# EAGLE design Frank_Hertz_Transimpedance_Amplifier (EAGLE 9.6.2)
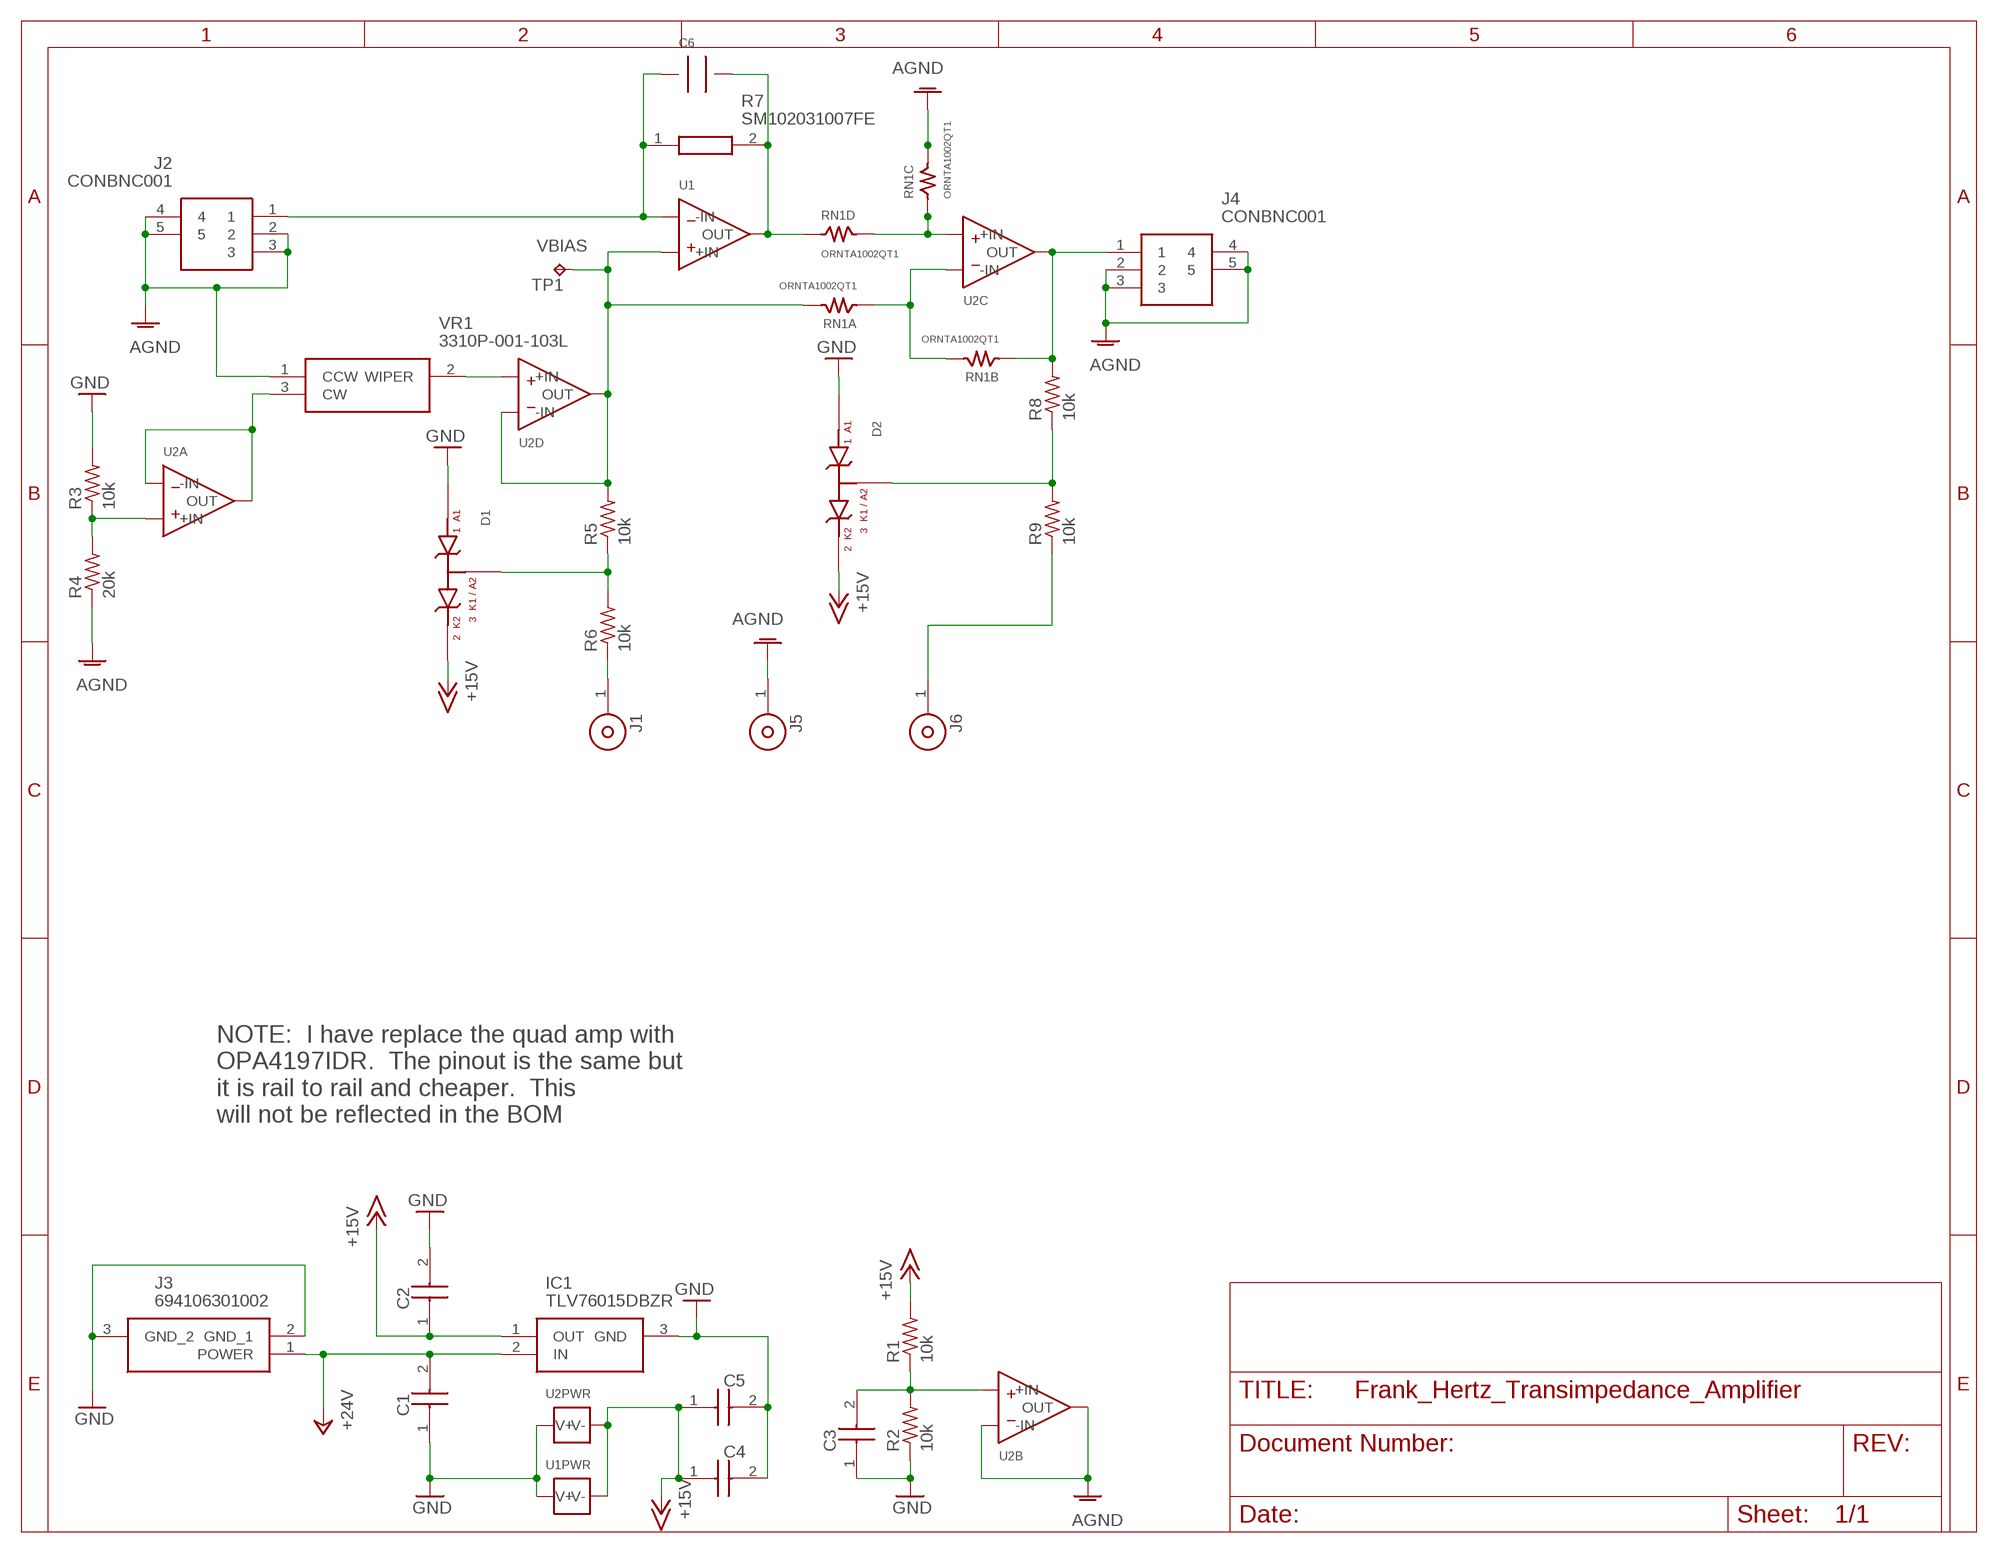
[diagram p0: schematic, sheet 1]

## Parts
C1  1uF  KAF21KR71H105JU  [CAPC2012X140N]
C2  1uF  KAF21KR71H105JU  [CAPC2012X140N]
C3  1uF  KAF21KR71H105JU  [CAPC2012X140N]
C4  CC0603KRX7R8BB104  [CAPC1608X90N]
C5  CC0603KRX7R8BB104  [CAPC1608X90N]
C6  C315C109D2G5TA_10.16MM  [C315_BENT_10.16MM]
D1  BAS70_04_SOT23COMMERCIAL_REELNXP  [SOT23-3_NEXPERIA]
D2  BAS70_04_SOT23COMMERCIAL_REELNXP  [SOT23-3_NEXPERIA]
IC1  TLV76015DBZR  [SOT95P237X112-3N]
J1  CINCH_108-0904-001  [CINCH_108-0904-001_BODGE]
J2  CONBNC001  [CONBNC001]
J3  694106301002  [694106301002]
J4  CONBNC001  [CONBNC001]
J5  CINCH_108-0904-001  [CINCH_108-0904-001_BODGE]
J6  CINCH_108-0904-001  [CINCH_108-0904-001_BODGE]
R1  10k  R-US_R0805  [R0805]
R2  10k  R-US_R0805  [R0805]
R3  10k  R-US_R0805  [R0805]
R4  20k  R-US_R0805  [R0805]
R5  10k  R-US_R0805  [R0805]
R6  10k  R-US_R0805  [R0805]
R7  SM102031007FE  [SM102031007FE]
R8  10k  R-US_R0805  [R0805]
R9  10k  R-US_R0805  [R0805]
RN1  ORNTA1002QT1  [SOIC8_MS012_AA_1.27MM]
TP1  TPB1,27  [B1,27]
U1  LMC6081IN/NOPB  [PDIP-8_300MIL]
U2  OPA4227UA_SOIC14  [SOIC-14_D]
VR1  3310P-001-103L  [3310P001103L]

## Nets
+15V: C2.1 C4.1 C5.1 D1.2(K2) D2.2(K2) IC1.1(OUT) R1.2 U1.7(V+) U2.4(PWR:V+)
+24V: C1.2 IC1.2(IN) J3.1(POWER)
AGND: J2.2 J2.3 J2.4 J2.5 J4.2 J4.3 J4.4 J4.5 J5.1 R4.1 RN1.6 U2.6(B:-IN) U2.7(B:OUT) VR1.1(CCW)
GND: C1.1 C2.2 C3.1 C4.2 C5.2 D1.1(A1) D2.1(A1) IC1.3(GND) J3.2(GND_1) J3.3(GND_2) R2.1 R3.2 U1.4(V-) U2.11(PWR:V-)
N$1: U2.12(D:+IN) VR1.2(WIPER)
N$2: C3.2 R1.1 R2.2 U2.5(B:+IN)
N$3: J6.1 R9.1
N$4: R3.1 R4.2 U2.3(A:+IN)
N$5: U2.1(A:OUT) U2.2(A:-IN) VR1.3(CW)
N$6: C6.1 J2.1 R7.1 U1.2(-IN)
N$7: RN1.1 RN1.7 U2.9(C:-IN)
N$8: C6.2 R7.2 RN1.4 U1.6(OUT)
N$9: RN1.3 RN1.5 U2.10(C:+IN)
N$10: J4.1 R8.2 RN1.2 U2.8(C:OUT)
N$11: D1.3(K1_A2) R5.1 R6.2
N$12: J1.1 R6.1
N$13: D2.3(K1_A2) R8.1 R9.2
VBIAS: R5.2 RN1.8 TP1.TP U1.3(+IN) U2.13(D:-IN) U2.14(D:OUT)

## Notes on the sheet
- NOTE:  I have replace the quad amp with 
  OPA4197IDR.  The pinout is the same but
  it is rail to rail and cheaper.  This
  will not be reflected in the BOM

## Library data of the parts
C1-C3 = KAF21KR71H105JU:KAF21KR71H105JU: Multilayer Ceramic Capacitors MLCC - SMD/SMT 50V 1uF X7R 0805 5% AEC-Q200 FlexiTerm Source: Datasheet <https://www.mouser.ph/ProductDetail/KYOCERA-AVX/KAF21KR71H105JU?qs=9vOqFld9vZWh8YVe5AsImg==&srsltid=AfmBOoplmrgUQOhbOhIhlm3WXiOMcA4op3G5lIOrTOHn0-XwebEw1J19>; DESCRIPTION: Multilayer Ceramic Capacitors MLCC - SMD/SMT 50V 1uF X7R 0805 5% AEC-Q200 FlexiTerm; HEIGHT: 1.4mm; MANUFACTURER_NAME: Kyocera AVX; MANUFACTURER_PART_NUMBER: KAF21KR71H105JU
C4 C5 = CC0603KRX7R8BB104:CC0603KRX7R8BB104: Cap Ceramic 0.1uF 25V X7R 10% Pad SMD 0603 125C T/R Source: Datasheet <https://www.arrow.com/en/products/cc0603krx7r8bb104/yageo?region=nac>; DESCRIPTION: Cap Ceramic 0.1uF 25V X7R 10% Pad SMD 0603 125C T/R; HEIGHT: 0.9mm; MANUFACTURER_NAME: Yageo Group; MANUFACTURER_PART_NUMBER: CC0603KRX7R8BB104; MOUSER_PART_NUMBER: 603-CC603KRX7R8BB104; MOUSER_PRICE-STOCK: https://www.mouser.co.uk/ProductDetail/YAGEO/CC0603KRX7R8BB104?qs=AgBp2OyFlx%252B4QOgEm%2Fb3YQ%3D%3D
C6 = KEMET_C315_1pF_C0G_10.16mm_BentLead:C315C109D2G5TA_10.16MM: KEMET C315C109D2G5TA, 1 pF, C0G/NP0, 200 V radial capacitor. Custom 10.16 mm PCB lead spacing to match Ohmite SM102031007FE 1 GΩ resistor footprint. Form capacitor leads outward before insertion; do not force the ceramic body.; CAPACITANCE: 1pF; DIELECTRIC: C0G/NP0; FOOTPRINT_NOTE: Custom 10.16mm formed-lead spacing; MANUFACTURER: KEMET; MPN: C315C109D2G5TA; VOLTAGE: 200V
D1 D2 = BAS70-04_SOT23:BAS70_04_SOT23: BAS70-04 dual-series Schottky diode Nexperia SOT23 (TO-236AB). Pin 1 = A1, pin 3 = K1/A2 series junction, pin 2 = K2. The symbol displays both physical diodes and all three pin numbers.; CONFIGURATION: DUAL SERIES; I_F: 70 mA; MANUFACTURER: Nexperia; MOUSER: 771-BAS70-04-T/R; MPN: BAS70-04,215; PACKAGE: SOT23 (TO-236AB); V_R: 70 V
IC1 = TLV76015DBZR:TLV76015DBZR: LDO Voltage Regulators 100mA, 30V Wide-VIN, Fixed-Output Linear-Voltage Regulator 3-SOT-23 -40 to 125 Source: Datasheet <http://www.ti.com/lit/gpn/tlv760>; DESCRIPTION: LDO Voltage Regulators 100mA, 30V Wide-VIN, Fixed-Output Linear-Voltage Regulator 3-SOT-23 -40 to 125; HEIGHT: 1.12mm; MANUFACTURER_NAME: Texas Instruments; MANUFACTURER_PART_NUMBER: TLV76015DBZR; MOUSER_PART_NUMBER: 595-TLV76015DBZR; MOUSER_PRICE-STOCK: https://www.mouser.co.uk/ProductDetail/Texas-Instruments/TLV76015DBZR?qs=HXFqYaX1Q2y4Be22WCYAvQ%3D%3D
J1 J5 J6 = Cinch_108-0904-001_Banana_Jack_v2:CINCH_108-0904-001: Cinch 108-0904-001 insulated banana jack Custom board-mount implementation: the jack passes through a large mechanical PCB hole and its rear solder terminal is jumpered to a nearby bottom-side SMD pad.; MANUFACTURER: Cinch Connectivity Solutions; MPN: 108-0904-001
J2 J4 = CONBNC001:CONBNC001: Body Features: Body Material Brass | Body Plating Material Nickel | Configuration Features: Number of Coaxial Contacts 1 | Number of Positions 1 | Electrical Characteristics: Impedance 50 OHM | Mechanical Attachment: Connector Mounting Type Board Mount | RF Connector Coupling Mechanism Bayonet | Operation/Application: Operating Frequency 3 GHZ | Circuit Application Signal | Other: Dielectric Material Polytetrafluoroethylene (PTFE) | Product Type Features: RF Connector Style Jack | Connector & Contact Termin Source: Datasheet <https://www.te.com/commerce/DocumentDelivery/DDEController?Action=srchrtrv&DocNm=CONBNC001&DocType=Data Sheet&DocLang=English&PartCntxt=CONBNC001&DocFormat=pdf>; DESCRIPTION: Body Features: Body Material Brass | Body Plating Material Nickel | Configuration Features: Number of Coaxial Contacts 1 | Number of Positions 1 | Electrical Characteristics: Impedance 50 OHM | Mechanical Attachment: Connector Mounting Type Board Mount | RF Connector Coupling Mechanism Bayonet | Operation/Application: Operating Frequency 3 GHZ | Circuit Application Signal | Other: Dielectric Material Polytetrafluoroethylene (PTFE) | Product Type Features: RF Connector Style Jack | Connector & Contact Termin; HEIGHT: 14.9mm; MANUFACTURER_NAME: TE Connectivity; MANUFACTURER_PART_NUMBER: CONBNC001; MOUSER_PART_NUMBER: 712-CONBNC001; MOUSER_PRICE-STOCK: https://www.mouser.co.uk/ProductDetail/TE-Connectivity-Linx-Technologies/CONBNC001?qs=doiCPypUmgHczHAGaJs8Lg%3D%3D
J3 = 694106301002:694106301002: WR-DCPJ_THT_R/A_Plastic DCPowerJack_THT_R/A_Plastic_CenterPin_ 2.0 Source: Datasheet <https://www.we-online.com/catalog/datasheet/694106301002.pdf>; DESCRIPTION: WR-DCPJ_THT_R/A_Plastic DCPowerJack_THT_R/A_Plastic_CenterPin_ 2.0; HEIGHT: 11mm; MANUFACTURER_NAME: Wurth Elektronik; MANUFACTURER_PART_NUMBER: 694106301002; MOUSER_PART_NUMBER: 710-694106301002; MOUSER_PRICE-STOCK: https://www.mouser.co.uk/ProductDetail/Wurth-Elektronik/694106301002?qs=a9WhcLg8qCwOEkcI62k5mA%3D%3D
R1-R6 R8 R9 = rcl:R-US_: RESISTOR, American symbol; SPICEPREFIX: R
R7 = SM102031007FE:SM102031007FE: Thick Film Resistors - Through Hole 1000M ohms 1% Source: Datasheet <https://componentsearchengine.com/Datasheets/2/SM102031007FE.pdf>; DESCRIPTION: Thick Film Resistors - Through Hole 1000M ohms 1%; HEIGHT: 8.64mm; MANUFACTURER_NAME: Ohmite; MANUFACTURER_PART_NUMBER: SM102031007FE; MOUSER_PART_NUMBER: 588-SM102031007FE; MOUSER_PRICE-STOCK: https://www.mouser.co.uk/ProductDetail/Ohmite/SM102031007FE?qs=i1vWiB0WGw%2FlCaVxH5tlIA%3D%3D
RN1 = Vishay_ORNTA1002QT1_Invokable:ORNTA1002QT1: Vishay ORNTA1002QT1: four isolated 10 kΩ matched thin-film resistors. Q tolerance code = ±0.05% absolute / ±0.01% ratio.; ABS_TOL: ±0.05%; MANUFACTURER: Vishay Dale Thin Film; MPN: ORNTA1002QT1; RATIO_TOL: ±0.01%; RESISTANCE: 10 kΩ x4 isolated; TCR: ±25 ppm/°C absolute; ±5 ppm/°C tracking
TP1 = testpad:TP: Test pad
U1 = LMC6081IN_PDIP8:LMC6081: LMC6081IN/NOPB — single precision CMOS op amp, ultra-low input bias, PDIP-8. Op-amp gate: -IN=2, +IN=3, OUT=6. Power gate PWR (INVOKE separately): V-=4, V+=7. Pins 1, 5, and 8 are NC and intentionally have no schematic gate connection.; CHANNELS: 1; MANUFACTURER: Texas Instruments; MPN: LMC6081IN/NOPB; PACKAGE: PDIP-8 (P)
U2 = OPA4227_Quad_OpAmp_EAGLE:OPA4227: OPA4227 — quad high-precision, low-noise operational amplifier. Gate A: OUT=1, -IN=2, +IN=3. Gate B: +IN=5, -IN=6, OUT=7. Gate C: OUT=8, -IN=9, +IN=10. Gate D: +IN=12, -IN=13, OUT=14. Power gate PWR (invoke separately): V+=4, V-=11. A-D are interchangeable gates and can be placed/invoked separately.; MANUFACTURER: Texas Instruments; MPN: OPA4227UA; PACKAGE: SOIC-14 (D)
VR1 = 3310P-001-103L:3310P-001-103L: Potentiometers 9mm 10Kohms Single Cup Source: Datasheet <https://componentsearchengine.com/Datasheets/2/3310P-001-103L.pdf>; DESCRIPTION: Potentiometers 9mm 10Kohms Single Cup; HEIGHT: 11.79mm; MANUFACTURER_NAME: Bourns; MANUFACTURER_PART_NUMBER: 3310P-001-103L; MOUSER_PART_NUMBER: 652-3310P-001-103L; MOUSER_PRICE-STOCK: https://www.mouser.co.uk/ProductDetail/Bourns/3310P-001-103L?qs=eLugBjTgzvMckyzv4fvguA%3D%3D

## Board
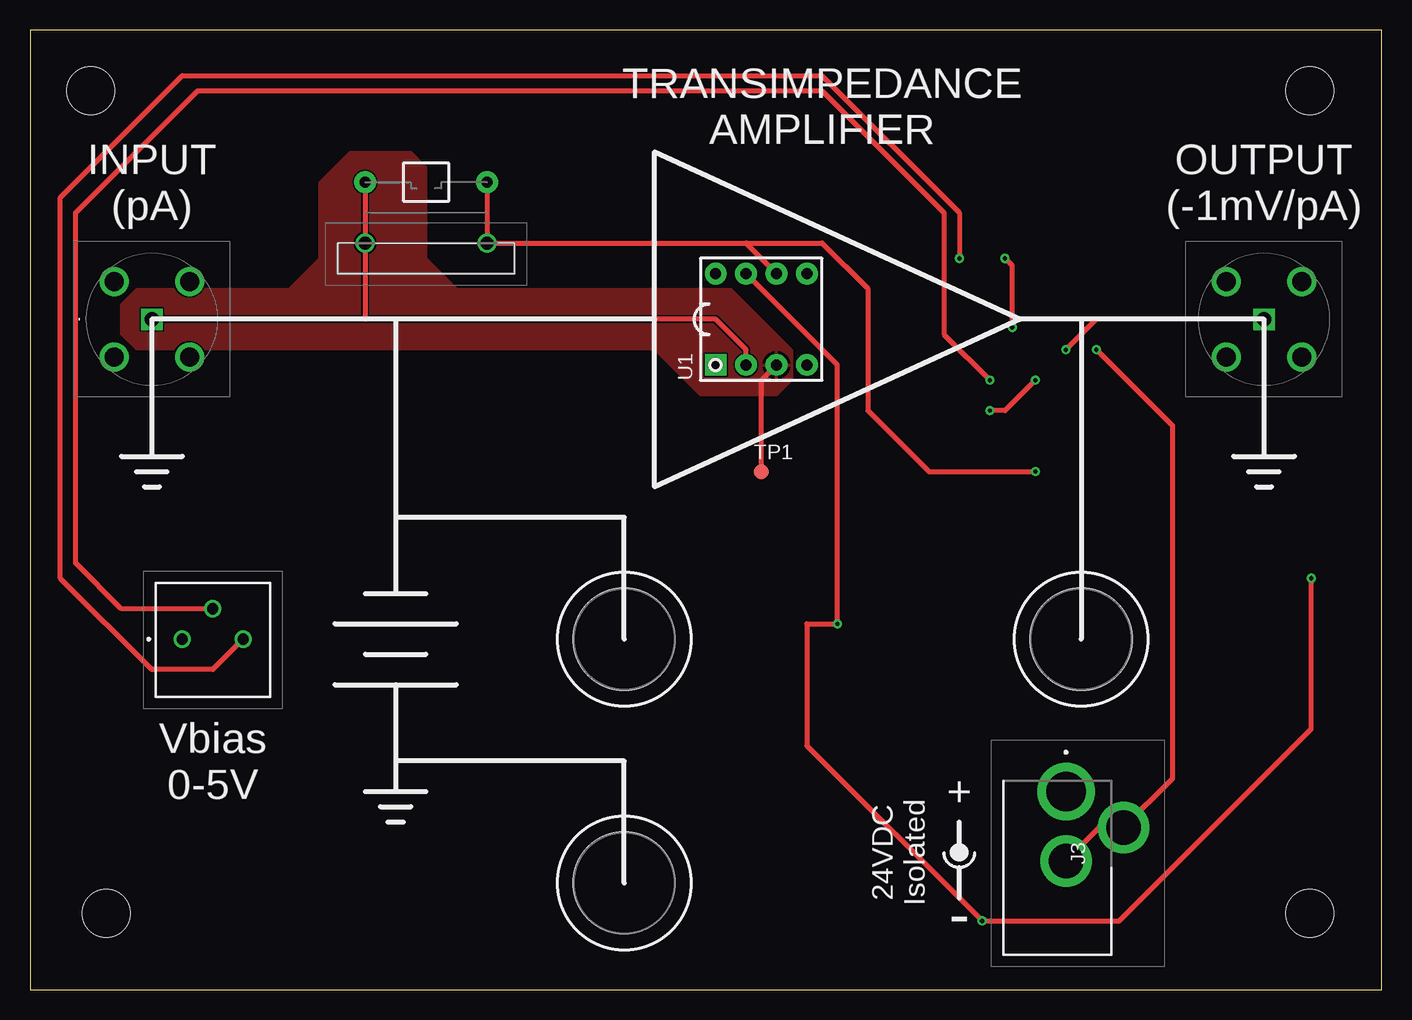
[diagram p1: board, top side]
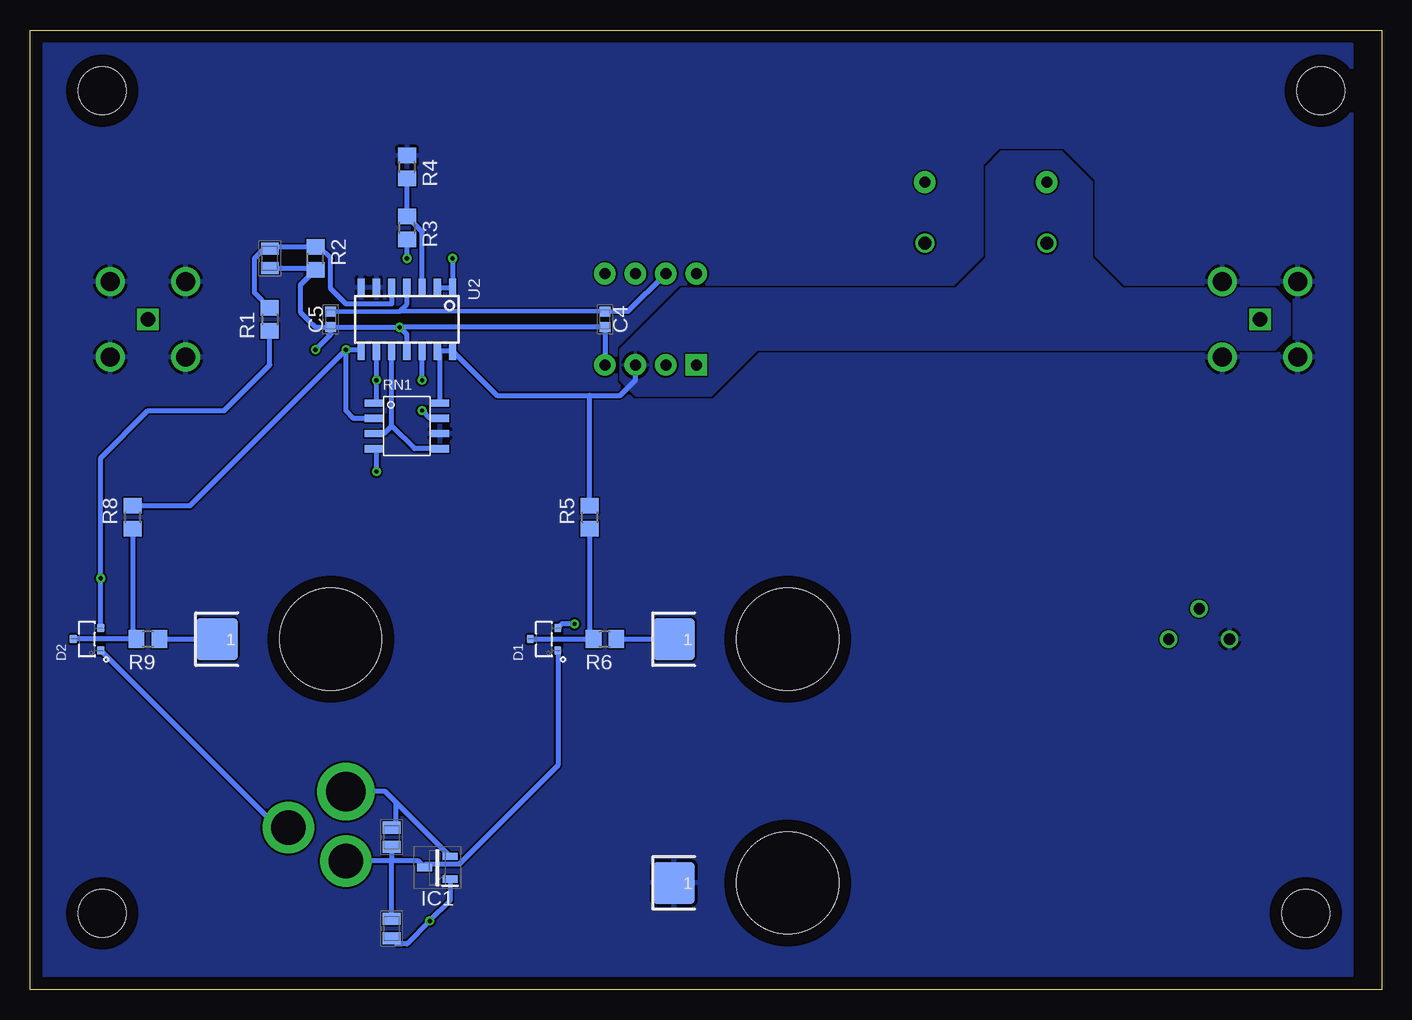
[diagram p2: board, bottom side, seen from below]

Size 112.7 x 80 mm. Coordinates in mm from the lower left corner, seen from the top.
Outline: 0,0 112.7,0 112.7,80 0,80 0,0
Copper layers (1*16): Top 0.035mm / dielectric 1.5mm / Bottom 0.035mm
Design rules "default *": minimum track width 6mil, minimum drill 0.35mm, track to track 6mil, track to pad 6mil, pad to pad 6mil, via to via 6mil, smd to smd 6mil, copper to edge 40mil, drill to drill 6mil, minimum pad ring 10mil, minimum via ring 8mil, stop-mask expansion 4mil, vias tented up to drill 14mil, thermal gap 10mil
Holes 3.99 mm at 5.08,74.93 6.35,6.35 106.68,6.35 106.68,74.93

### Footprints (pad centres in the part's own frame; a part is rotated, then mirrored left to right if it is on the bottom)
CAPC2012X140N = smd 1.02 x 1.47: 1 -0.81,0; 2 0.81,0
CAPC1608X90N = smd 0.83 x 0.94: 1 -0.66,0; 2 0.66,0
C315_BENT_10.16MM = drill 0.9 pad 1.8: 1 -5.08,0; 2 5.08,0
SOT23-3_NEXPERIA = smd 0.7 x 0.6: 1 -0.95,-1.15; 2 0.95,-1.15; 3 0,1.15
SOT95P237X112-3N = smd 1.25 x 0.6: 1 -1.05,0.95; 2 -1.05,-0.95; 3 1.05,0
CINCH_108-0904-001_BODGE = smd 3.5 x 3.5 bottom: 1 9.5,0 | hole 8.5: 0,0
CONBNC001 = drill 1.2 pad 1.8 square: 1 0,0 | drill 1.6 pad 2.4: 2 -3.15,3.15; 3 -3.15,-3.15; 4 3.15,-3.15; 5 3.15,3.15
694106301002 = drill 3.28 pad 4.8: 1 0,0 | drill 2.886 pad 4.3: 2 -5.8,0; 3 -3,-4.8
R0805 = smd 1.3 x 1.5: 1 -0.95,0; 2 0.95,0
SM102031007FE = drill 1.064 pad 1.404: 1 0,0; 2 10.16,0
SOIC8_MS012_AA_1.27MM = smd 1.55 x 0.6: 1 -2.75,1.905; 2 -2.75,0.635; 3 -2.75,-0.635; 4 -2.75,-1.905; 5 2.75,-1.905; 6 2.75,-0.635; 7 2.75,0.635; 8 2.75,1.905
B1,27 = smd 1.27 x 1.27: TP 0,0
PDIP-8_300MIL = drill 0.9 pad 1.8 square: 1 0,7.62 | drill 0.9 pad 1.8: 2 0,5.08; 3 0,2.54; 4 0,0; 5 7.62,0; 6 7.62,2.54; 7 7.62,5.08; 8 7.62,7.62
SOIC-14_D = smd 1.5 x 0.6: 1 -2.65,3.81; 2 -2.65,2.54; 3 -2.65,1.27; 4 -2.65,0; 5 -2.65,-1.27; 6 -2.65,-2.54; 7 -2.65,-3.81; 8 2.65,-3.81; 9 2.65,-2.54; 10 2.65,-1.27; 11 2.65,0; 12 2.65,1.27; 13 2.65,2.54; 14 2.65,3.81
3310P001103L = drill 0.92 pad 1.4: 1 0,0; 2 2.54,2.54; 3 5.08,0

### Placement (x,y rotation side)
C1  82.55,12.7 90 bottom
C2  82.55,5.08 90 bottom
C3  92.71,60.96 90 bottom
C4  64.77,55.88 270 bottom
C5  87.63,55.88 270 bottom
C6  33.02,67.31 0 top
D1  69.85,29.21 90 bottom
D2  107.95,29.21 90 bottom
IC1  78.74,10.16 180 bottom
J1  49.53,29.21 0 top
J2  10.16,55.88 0 top
J3  86.36,16.51 90 top
J4  102.87,55.88 0 top
J5  49.53,8.89 0 top
J6  87.63,29.21 0 top
R1  92.71,55.88 270 bottom
R2  88.9,60.96 90 bottom
R3  81.28,63.5 270 bottom
R4  81.28,68.58 270 bottom
R5  66.04,39.37 90 bottom
R6  64.77,29.21 180 bottom
R7  27.94,62.23 0 top
R8  104.14,39.37 90 bottom
R9  102.87,29.21 180 bottom
RN1  81.28,46.99 0 bottom
TP1  60.96,43.18 0 top
U1  64.77,52.07 90 top
U2  81.28,55.88 270 bottom
VR1  12.7,29.21 0 top

### Tracks (layer width: path | path; a pad name or v marks a point on that pad's centre or on a via)
+15V  (via drill 0.35)
  Top 0.406: U1.7 67.31,52.07 v67.31,30.48 64.77,30.48 64.77,20.32 v79.38,5.71 90.81,5.71 106.8,21.71 v106.8,34.29
  Bottom 0.406: IC1.1 77.69,7.4 v79.38,5.71 81.28,3.81 82.09,3.81 C2.1 | v67.31,30.48 68.38,30.48 D1.2 | D2.2 v106.8,34.29 106.8,44.33 102.87,48.26 96.52,48.26 92.71,52.07 R1.2 | C5.1 81.88,56.55 | 81.88,56.55 81.28,57.15 U2.4 | 81.88,56.55 C4.1 62.83,56.55 U1.7
+24V
  Bottom 0.406: IC1.2 82.19,15.61 | 82.19,15.61 83.09,16.51 J3.1 | C1.2 82.19,13.88 82.19,15.61
AGND
  pour Bottom (rank 2): 2.54,1.27 2.54,78.74 111.76,78.74 111.76,1.27
GND  (via drill 0.35)
  Top 0.406: J3.2 89.16,13.51 J3.3 95.25,17.6 95.25,46.99 v88.9,53.34 | v81.88,55.21 81.88,60.36 v81.28,60.96
  Bottom 0.406: IC1.3 79.9,10.27 | 79.9,10.27 80.34,10.71 82.55,10.71 | 82.55,10.71 J3.2 | C1.1 82.55,10.71 | C2.2 82.55,10.71 | C3.1 89.04,60.15 R2.1 90.17,58.74 90.17,56.48 89.48,55.79 88.9,55.22 C5.2 | 79.9,10.27 79.72,10.45 76.92,10.45 68.7,18.67 D1.1 | D2.1 92.05,13.51 J3.3 | U2.11 81.28,54.61 v81.88,55.21 | U1.4 C4.2 v81.88,55.21 | v88.9,53.34 87.63,54.61 C5.2 | C5.2 v81.88,55.21 | v81.28,60.96 R3.2
N$1  (via drill 0.35)
  Top 0.406: VR1.2 7.62,31.75 3.81,35.56 3.81,64.77 13.97,74.93 66.04,74.93 76.2,64.77 76.2,54.61 v80.01,50.8
  Bottom 0.406: v80.01,50.8 U2.12
N$2
  Bottom 0.406: R1.1 93.98,58.1 93.98,60.96 93.17,61.77 C3.2 92.57,61.91 R2.2 88.58,61.91 87.63,60.96 87.63,58.42 86.36,57.15 82.55,57.15 U2.5
N$3
  Bottom 0.406: R9.1 J6.1
N$4
  Bottom 0.406: R4.2 R3.1 80.39,63.56 80.38,63.56 80.01,63.18 U2.3
N$5  (via drill 0.35)
  Top 0.406: VR1.3 15.24,26.67 10.16,26.67 2.54,34.29 2.54,66.04 12.7,76.2 66.04,76.2 77.47,64.77 v77.47,60.96
  Bottom 0.406: U2.2 U2.1 v77.47,60.96
N$6
  Top 0.406: U1.2 59.69,53.34 57.15,55.88 27.94,55.88 | 27.94,55.88 J2.1 | C6.1 27.94,64.77 R7.1 27.94,55.88
N$7  (via drill 0.35)
  Top 0.406: v83.82,50.8 81.28,48.26 v80.01,48.26
  Bottom 0.406: U2.9 v83.82,50.8 83.82,49.1 RN1.1 | v80.01,48.26 79.38,47.62 RN1.7
N$8  (via drill 0.35)
  Top 0.406: C6.2 R7.2 59.69,62.23 | U1.6 59.69,62.23 | 59.69,62.23 66.04,62.23 69.85,58.42 69.85,48.26 74.93,43.18 v83.82,43.18
  Bottom 0.406: v83.82,43.18 83.82,44.88 RN1.4
N$9
  Bottom 0.406: RN1.3 83.19,46.35 82.55,46.99 | 82.55,46.99 U2.10 | RN1.5 80.64,45.09 82.55,46.99
N$10  (via drill 0.35)
  Top 0.406: J4.1 88.9,55.88 v86.36,53.34
  Bottom 0.406: v86.36,53.34 85.2,53.34 U2.8 | v86.36,53.34 99.38,40.32 R8.2 | RN1.2 85.72,47.62 86.36,48.26 v86.36,53.34
N$11
  Bottom 0.406: R5.1 66.04,29.21 R6.2 D1.3
N$12
  Bottom 0.406: R6.1 J1.1
N$13
  Bottom 0.406: R9.2 104.14,29.21 | 104.14,29.21 D2.3 | R8.1 104.14,29.21
VBIAS
  Top 0.406: TP1.TP 60.96,50.8 U1.3
  Bottom 0.406: 66.04,49.53 73.77,49.53 U2.14 U2.13 78.53,53.02 RN1.8 | 66.04,49.53 63.5,49.53 62.23,50.8 U1.3 | R5.2 66.04,49.53
  pour Top: 7.62,54.61 7.62,57.15 8.89,58.42 21.59,58.42 24.13,60.96 24.13,67.31 26.67,69.85 31.75,69.85 33.02,68.58 33.02,60.96 35.56,58.42 58.42,58.42 63.5,53.34 63.5,50.8 62.23,49.53 55.88,49.53 52.07,53.34 8.89,53.34
  pour Bottom: 7.62,54.61 7.62,57.15 8.89,58.42 21.59,58.42 24.13,60.96 24.13,67.31 26.67,69.85 31.75,69.85 33.02,68.58 33.02,60.96 35.56,58.42 58.42,58.42 63.5,53.34 63.5,50.8 62.23,49.53 55.88,49.53 52.07,53.34 8.89,53.34

### Text on the board
tPlace: TRANSIMPEDANCE / AMPLIFIER | INPUT / (pA) | OUTPUT / (-1mV/pA) | Vbias / 0-5V | + | 24VDC / Isolated | -